# Altium schematic sheet Controller_sheet.SchDoc
size A4; SheetNumber: 2; SheetTotal: 4
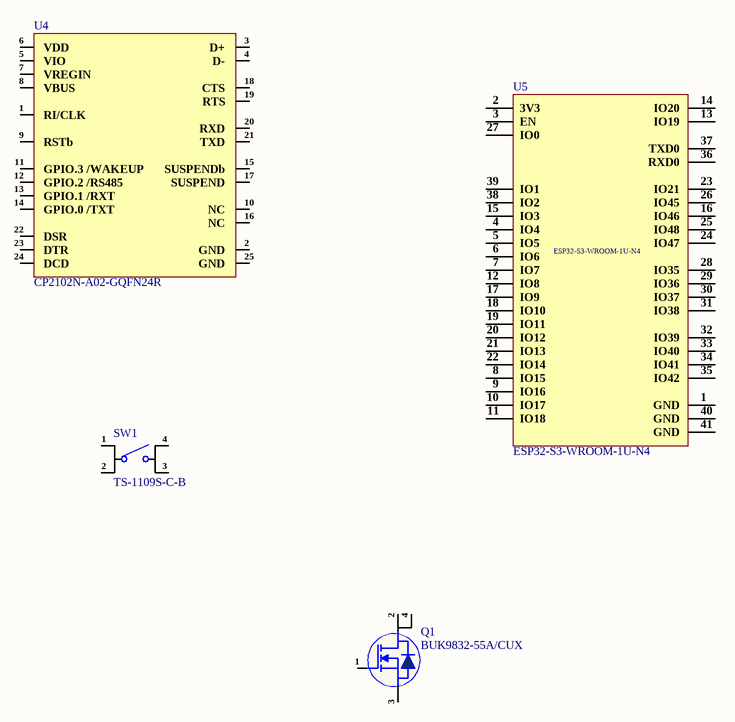
[diagram p0: Controller_sheet.SchDoc]

## Parts
Q1  BUK9832-55A/CUX  [SOT- 223]
SW1  TS-1109S-C-B  [TS-1109S-C-B]
U4  CP2102N-A02-GQFN24R  [24-WQFN (4x4)]
U5  ESP32-S3-WROOM-1U-N4  [41-SMD UFL Module]

## Nets

Not connected (* = marked no-connect by the designer): Q1 1(G) 2(D) 3(S) 4(D); SW1 1 2 3 4; U4 1(RI/CLK) 2(GND) 3(D+) 4(D-) 5(VIO) 6(VDD) 7(VREGIN) 8(VBUS) 9(RSTb) 10(NC) 11(GPIO.3_/WAKEUP) 12(GPIO.2_/RS485) 13(GPIO.1_/RXT) 14(GPIO.0_/TXT) 15(SUSPENDb) 16(NC) 17(SUSPEND) 18(CTS) 19(RTS) 20(RXD) 21(TXD) 22(DSR) 23(DTR) 24(DCD) 25(GND); U5 1(GND) 2(3V3) 3(EN) 4(IO4) 5(IO5) 6(IO6) 7(IO7) 8(IO15) 9(IO16) 10(IO17) 11(IO18) 12(IO8) 13(IO19) 14(IO20) 15(IO3) 16(IO46) 17(IO9) 18(IO10) 19(IO11) 20(IO12) 21(IO13) 22(IO14) 23(IO21) 24(IO47) 25(IO48) 26(IO45) 27(IO0) 28(IO35) 29(IO36) 30(IO37) 31(IO38) 32(IO39) 33(IO40) 34(IO41) 35(IO42) 36(RXD0) 37(TXD0) 38(IO2) 39(IO1) 40(GND) 41(GND)

## Notes on the sheet
- File:
- Title:
- Date:
- Page
- Num:
- Total:
- Drawn By: Huzaifa Ali

## Library data of the parts
Q1 = BUK9832-55A/CUX: MOSFET N-CH 55V 12A SOT223; Manufacturer: Nexperia; Item Type: MOSFETs; Input Capacitance: 1.594nF; Max Power Dissipation: 8W; Rds On Max: 29mR; Fall Time: 68ns; Gate to Source Voltage (Vgs): 10V; Rise Time: 125ns; Turn-Off Delay Time: 64ns; Turn-On Delay Time: 14ns; Supplier: Future Electronics; LCSC Part Number: C458151; Manufacturer Part Number: BUK9832-55A/CUX; RoHS: Yes; Stock: 59000; Pricing: 1000=0.305, 2000=0.295, 4000=0.29, 5000=0.29, 15000=0.275 (USD); Case/Package: 73Case; Pins: 4NUMBER; Contact Plating: 154ConductorMaterial; Min Operating Temperature: -55°C; Max Operating Temperature: 150°C; Packaging: 10Packaging; Continuous Drain Current (ID): 12A; Drain to Source Voltage (Vdss): 55V; Max Dual Supply Voltage: 55V; ComponentLink1URL: https://www.mouser.com/ds/2/302/BUK9832-55A-196161.pdf?src-supplier=Mouser; ComponentLink1Description: https://www.mouser.com/ds/2/302/BUK9832-55A-196161.pdf?src-supplier=Mouser; ComponentLink2URL: http://datasheet.octopart.com/BUK9832-55A-CUX-Nexperia-datasheet-87843131.pdf?src-supplier=Newark; ComponentLink2Description: http://datasheet.octopart.com/BUK9832-55A-CUX-Nexperia-datasheet-87843131.pdf?src-supplier=Newark; ComponentLink3URL: http://datasheet.octopart.com/BUK9832-55A-CUX-Nexperia-datasheet-87843131.pdf?src-supplier=Avnet; ComponentLink3Description: http://datasheet.octopart.com/BUK9832-55A-CUX-Nexperia-datasheet-87843131.pdf?src-supplier=Avnet; ComponentLink4URL: http://datasheet.octopart.com/BUK9832-55A-CUX-Nexperia-datasheet-87843131.pdf?src-supplier=Farnell; ComponentLink4Description: http://datasheet.octopart.com/BUK9832-55A-CUX-Nexperia-datasheet-87843131.pdf?src-supplier=Farnell; ComponentLink5URL: http://datasheet.octopart.com/BUK9832-55A-CUX-Nexperia-datasheet-87843131.pdf?src-supplier=Digikey; ComponentLink5Description: http://datasheet.octopart.com/BUK9832-55A-CUX-Nexperia-datasheet-87843131.pdf?src-supplier=Digikey; ComponentLink6URL: https://assets.nexperia.com/documents/data-sheet/BUK9832-55A.pdf?src-supplier=Digikey; ComponentLink6Description: https://assets.nexperia.com/documents/data-sheet/BUK9832-55A.pdf?src-supplier=Digikey; ComponentLink7URL: https://datasheet.octopart.com/BUK9832-55A-CUX-Nexperia-datasheet-87843131.pdf?src-supplier=Future+Electronics; ComponentLink7Description: https://datasheet.octopart.com/BUK9832-55A-CUX-Nexperia-datasheet-87843131.pdf?src-supplier=Future+Electronics; ComponentLink8URL: http://datasheet.octopart.com/BUK9832-55A-CUX-Nexperia-datasheet-87843131.pdf?src-supplier=TME; ComponentLink8Description: http://datasheet.octopart.com/BUK9832-55A-CUX-Nexperia-datasheet-87843131.pdf?src-supplier=TME; ComponentLink9URL: http://datasheet.octopart.com/BUK9832-55A-CUX-Nexperia-datasheet-87843131.pdf?src-supplier=Quest; ComponentLink9Description: http://datasheet.octopart.com/BUK9832-55A-CUX-Nexperia-datasheet-87843131.pdf?src-supplier=Quest; ComponentLink10URL: http://datasheet.octopart.com/BUK9832-55A-CUX-Nexperia-datasheet-87843131.pdf?src-supplier=TTI; ComponentLink10Description: http://datasheet.octopart.com/BUK9832-55A-CUX-Nexperia-datasheet-87843131.pdf?src-supplier=TTI
SW1 = TS-1109S-C-B: No NO 50mA 4.5mm 100000 260gf 12V -30℃~+85℃ 4.5mm 4.3mm Black Round Button Brick nogging SPST SMD Tactile Switches ROHS; Manufacturer: XKB Connectivity; Item Type: Switch; Manufacturer Part Number: TS-1109S-C-B; Package: Custom; LCSC Part Number: C381037; ComponentLink1Description: LCSC; ComponentLink1URL: https://www.lcsc.com/product-detail/Tactile-Switches_XKB-Connectivity-TS-1109S-C-B_C381037.html
U4 = CP2102N-A02-GQFN24R: IC USB TO UART BRIDGE QFN24; Manufacturer: Silicon Labs; Supplier 1: Digi-Key; Manufacturer Part Number: CP2102N-A02-GQFN24R; RoHS: Yes; Item Type: IC; Pricing 1: 1=1.56000 (USD); Supplier Part Number 1: 336-5888-1-ND; LCSC Part Number: C969151
U5 = ESP32-S3-WROOM-1U-N4: RF TXRX MOD WIFI SURFACE MOUNT; Manufacturer: Espressif Systems; Item Type: Module; Supplier 1: Digi-Key; Manufacturer Part Number: ESP32-S3-WROOM-1U-N4; RoHS: No; Category: Uncategorized; Stock 1: 594; Pricing 1: 1=3.25000 (USD); Supplier Part Number 1: 1965-ESP32-S3-WROOM-1U-N4CT-ND; ComponentLink1Description: LCSC; ComponentLink1URL: https://www.lcsc.com/product-detail/WiFi-Modules_Espressif-Systems-ESP32-WROOM-32-N4_C82899.html; LCSC Part Number: C2980296